# Altium schematic sheet Sheet2.SchDoc
size 410 x 297 mm; SheetNumber: 3; SheetTotal: 3
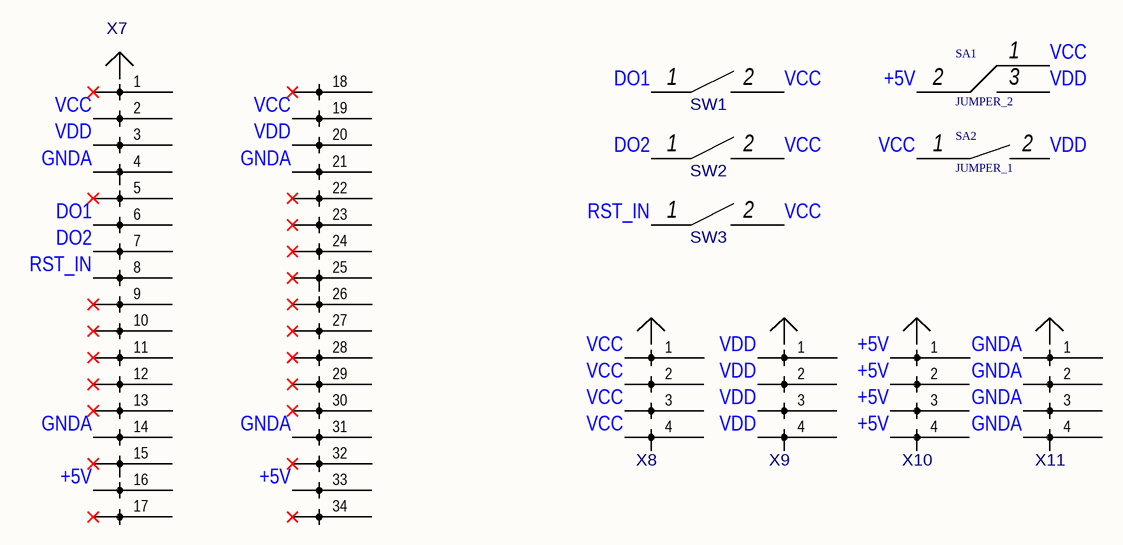
[diagram p0: Sheet2.SchDoc]

## Parts
SA1  JUMPER_2  [PLS3-2,54]
SA2  JUMPER_1  [PLS2-2,54]
SW1  ВКН1  [BKN1]  (value not drawn)
SW2  ВКН1  [BKN1]  (value not drawn)
SW3  ВКН1  [BKN1]  (value not drawn)
X7  PLD34-2,54  [PLD34-2,54]  (value not drawn)
X8  PLS4-2,54  [PLS4-2,54]  (value not drawn)
X9  PLS4-2,54  [PLS4-2,54]  (value not drawn)
X10  PLS4-2,54  [PLS4-2,54]  (value not drawn)
X11  PLS4-2,54  [PLS4-2,54]  (value not drawn)

## Nets
+5V: SA1.2 X7.16 X7.33 X10.1 X10.2 X10.3 X10.4
DO1: SW1.1 X7.6
DO2: SW2.1 X7.7
GNDA: X7.4 X7.14 X7.21 X7.31 X11.1 X11.2 X11.3 X11.4
RST_IN: SW3.1 X7.8
VCC: SA1.1 SA2.1 SW1.2 SW2.2 SW3.2 X7.2 X7.19 X8.1 X8.2 X8.3 X8.4
VDD: SA1.3 SA2.2 X7.3 X7.20 X9.1 X9.2 X9.3 X9.4

Not connected (* = marked no-connect by the designer): X7 1* 5* 9* 10* 11* 12* 13* 15* 17* 18* 22* 23* 24* 25* 26* 27* 28* 29* 30* 32* 34*

## Notes on the sheet
- Перв. примен.
- Справ. №
- Подп. и дата
- Инв. № дубл.
- Взам. инв. №
- Разраб.
- Изм.
- Лист
- № докум.
- Подп.
- Дата
- Литера
- Масса
- Масштаб
- Пров.
- Т.контр.
- Листов
- Инв. № подл.
- Н.контр.
- Утв.
- Форма 1 ГОСТ 2.104-2006
- Копировал
- Формат А3

## Library data of the parts
SW1-SW3 = ВКН1: Component Heigt: 5.2; Component Weigt: 1; Leadform: в отверстия по чертежу; NN: 25100618; KIND: Выключатель кнопочный ВКН-1 АСЖР.642130.003ТУ; ClassName: *; Component Link: *
X7 = PLD34-2,54: ComponentHeigt: 5.5; Name: Вилка; Specification: Вилка PLD2-2 *; Typ: PLD2-2; ClassName: *; Component Link: *; ComponentWeigt: *; Firme: *; Leadform: *; NN: *; KIND: *
X8-X11 = PLS4-2,54: ComponentHeigt: 5.5; Name: Вилка; Specification: Вилка PLD2-2 *; Typ: PLD2-2; ClassName: *; Component Link: *; ComponentWeigt: *; Firme: *; Leadform: *; NN: *; KIND: *